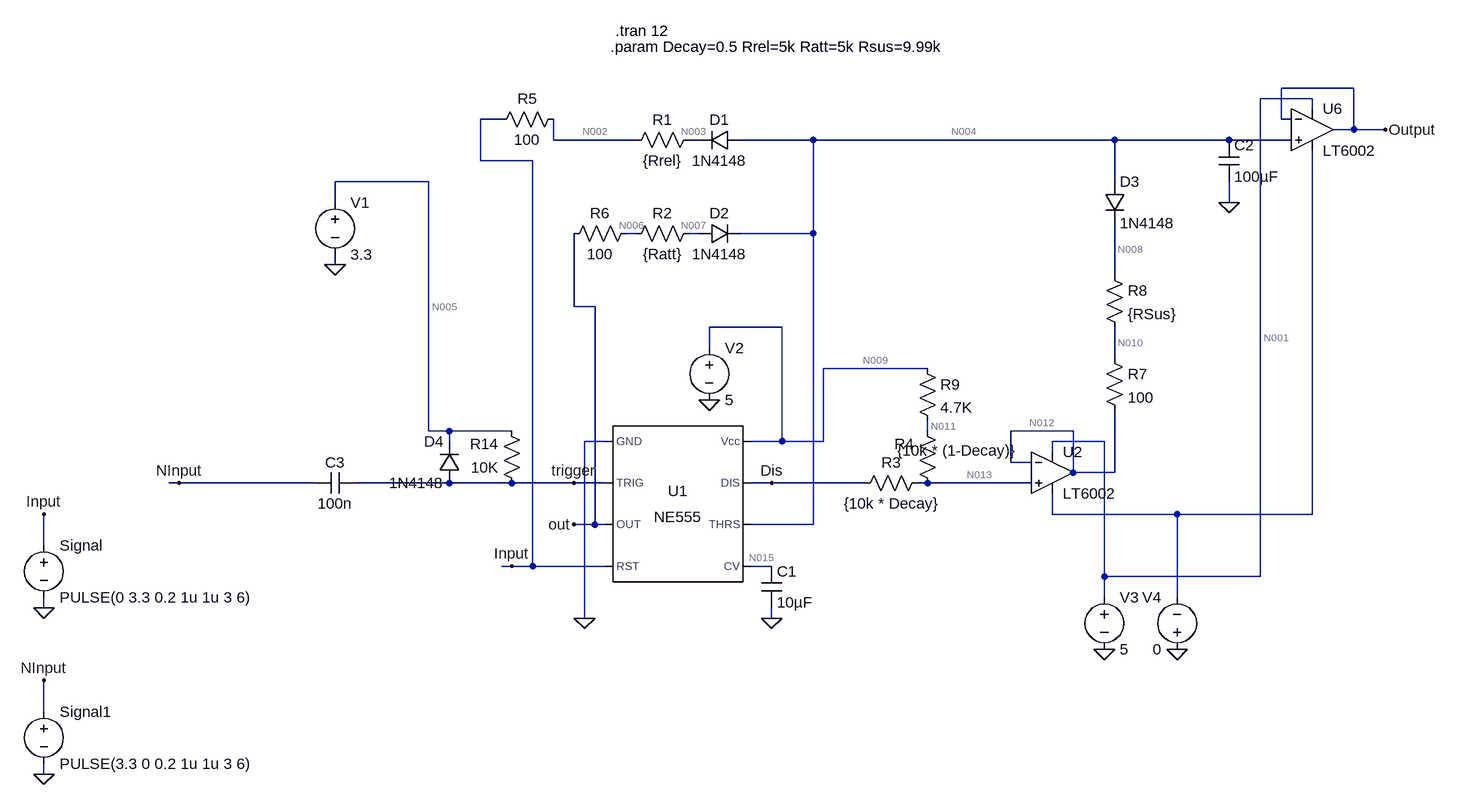
[diagram p0: schematic Envelope Generator werkend.asc]
* Envelope Generator werkend.asc
X§U1 0 trigger out Input N015 N004 Dis N009 NE555  ; pins GND TRIG OUT RST CV THRS DIS Vcc
V§Signal Input 0 PULSE(0 3.3 0.2 1u 1u 3 6)
C1 N015 0 10µF
D1 N004 N003 1N4148
D2 N007 N004 1N4148
R1 N003 N002 {Rrel}
R2 N007 N006 {Ratt}
R5 N002 Input 100
R6 N006 out 100
V2 N009 0 5
V3 N001 0 5
V4 0 N014 0
R7 N010 N012 100
R8 N008 N010 {RSus}
D3 N004 N008 1N4148
C2 N004 0 100µF
R3 N013 Dis {10k * Decay}
R4 N013 N011 {10k * (1-Decay)}
R9 N009 N011 4.7K
V1 N005 0 3.3
R14 trigger N005 10K
D4 trigger N005 1N4148
C3 trigger NInput 100n
* U6: LT6002 (symbol OpAmps\LT6002 not available, pins judged from their places): In+=N004 In-=Output V+=N001 V-=N014 OUT=Output
* U2: LT6002 (symbol OpAmps\LT6002 not available, pins judged from their places): In+=N013 In-=N012 V+=N001 V-=N014 OUT=N012
V§Signal1 NInput 0 PULSE(3.3 0 0.2 1u 1u 3 6)
.model D D
.lib standard.dio
.param Decay=0.5 Rrel=5k Ratt=5k Rsus=9.99k
.tran 12
.lib NE555.sub
.backanno
.end

* Results of the author's LTspice run, read from the files saved beside the schematic
* Operating Point, zero values left out:
*   V(out) = 30.01 µV
*   V(n015) = 3.333 V
*   V(n004) = 42.18 mV
*   V(n009) = 5 V
*   V(n002) = 386.9 nV
*   V(n001) = 5 V
*   V(n012) = 1.702 V
*   V(n011) = 3.402 V
*   V(ninput) = 3.3 V
*   V(trigger) = 3.3 V
*   V(dis) = 2.04 mV
*   V(n003) = 19.73 µV
*   V(n007) = 37.79 µV
*   V(n006) = 30.16 µV
*   V(n010) = 1.702 V
*   V(n008) = 1.702 V
*   V(n013) = 1.702 V
*   V(n005) = 3.3 V
*   V(output) = 42.2 mV
*   I(R2) = 1.526 nA
*   I(R6) = 1.526 nA
*   I(D3) = -2.522 nA
*   I(R3) = 340 µA
*   I(R4) = -340 µA
*   I(V1) = -3.3 nA
*   I(D4) = -1.833 pA
*   I(Signal) = 400 µA
*   I(D1) = 3.869 nA
*   I(V2) = -2.328 mA
*   I(V4) = -44.36 µA
*   I(R5) = 3.869 nA
*   I(R7) = -2.522 nA
*   I(R8) = -2.522 nA
*   I(R9) = 340 µA
*   I(R14) = -3.298 nA
*   I(D2) = -1.526 nA
*   I(R1) = 3.869 nA
*   I(V3) = -44.37 µA
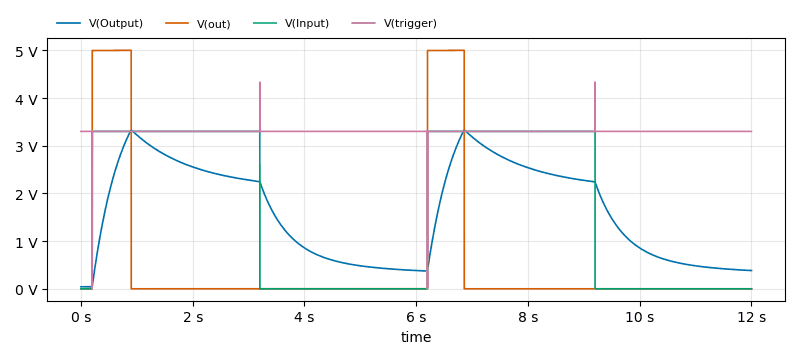
[diagram p1: Transient Analysis of Envelope Generator werkend.asc, plotted from the saved traces]
* Transient Analysis, 1 run:
*   V(Output): min 42.2 mV, max 3.334 V, average 1.614 V, rms 1.908 V, last 382.5 mV
*   V(out): min 30.01 µV, max 4.999 V, average 564.9 mV, rms 1.68 V, last 30.01 µV
*   V(Input): min 0 V, max 3.3 V, average 1.65 V, rms 2.333 V, last 0 V
*   V(trigger): min 1.727 mV, max 4.334 V, average 3.299 V, rms 3.3 V, last 3.3 V